# Altium project BMS-v1.1.PrjPcb (part 3 of 3)
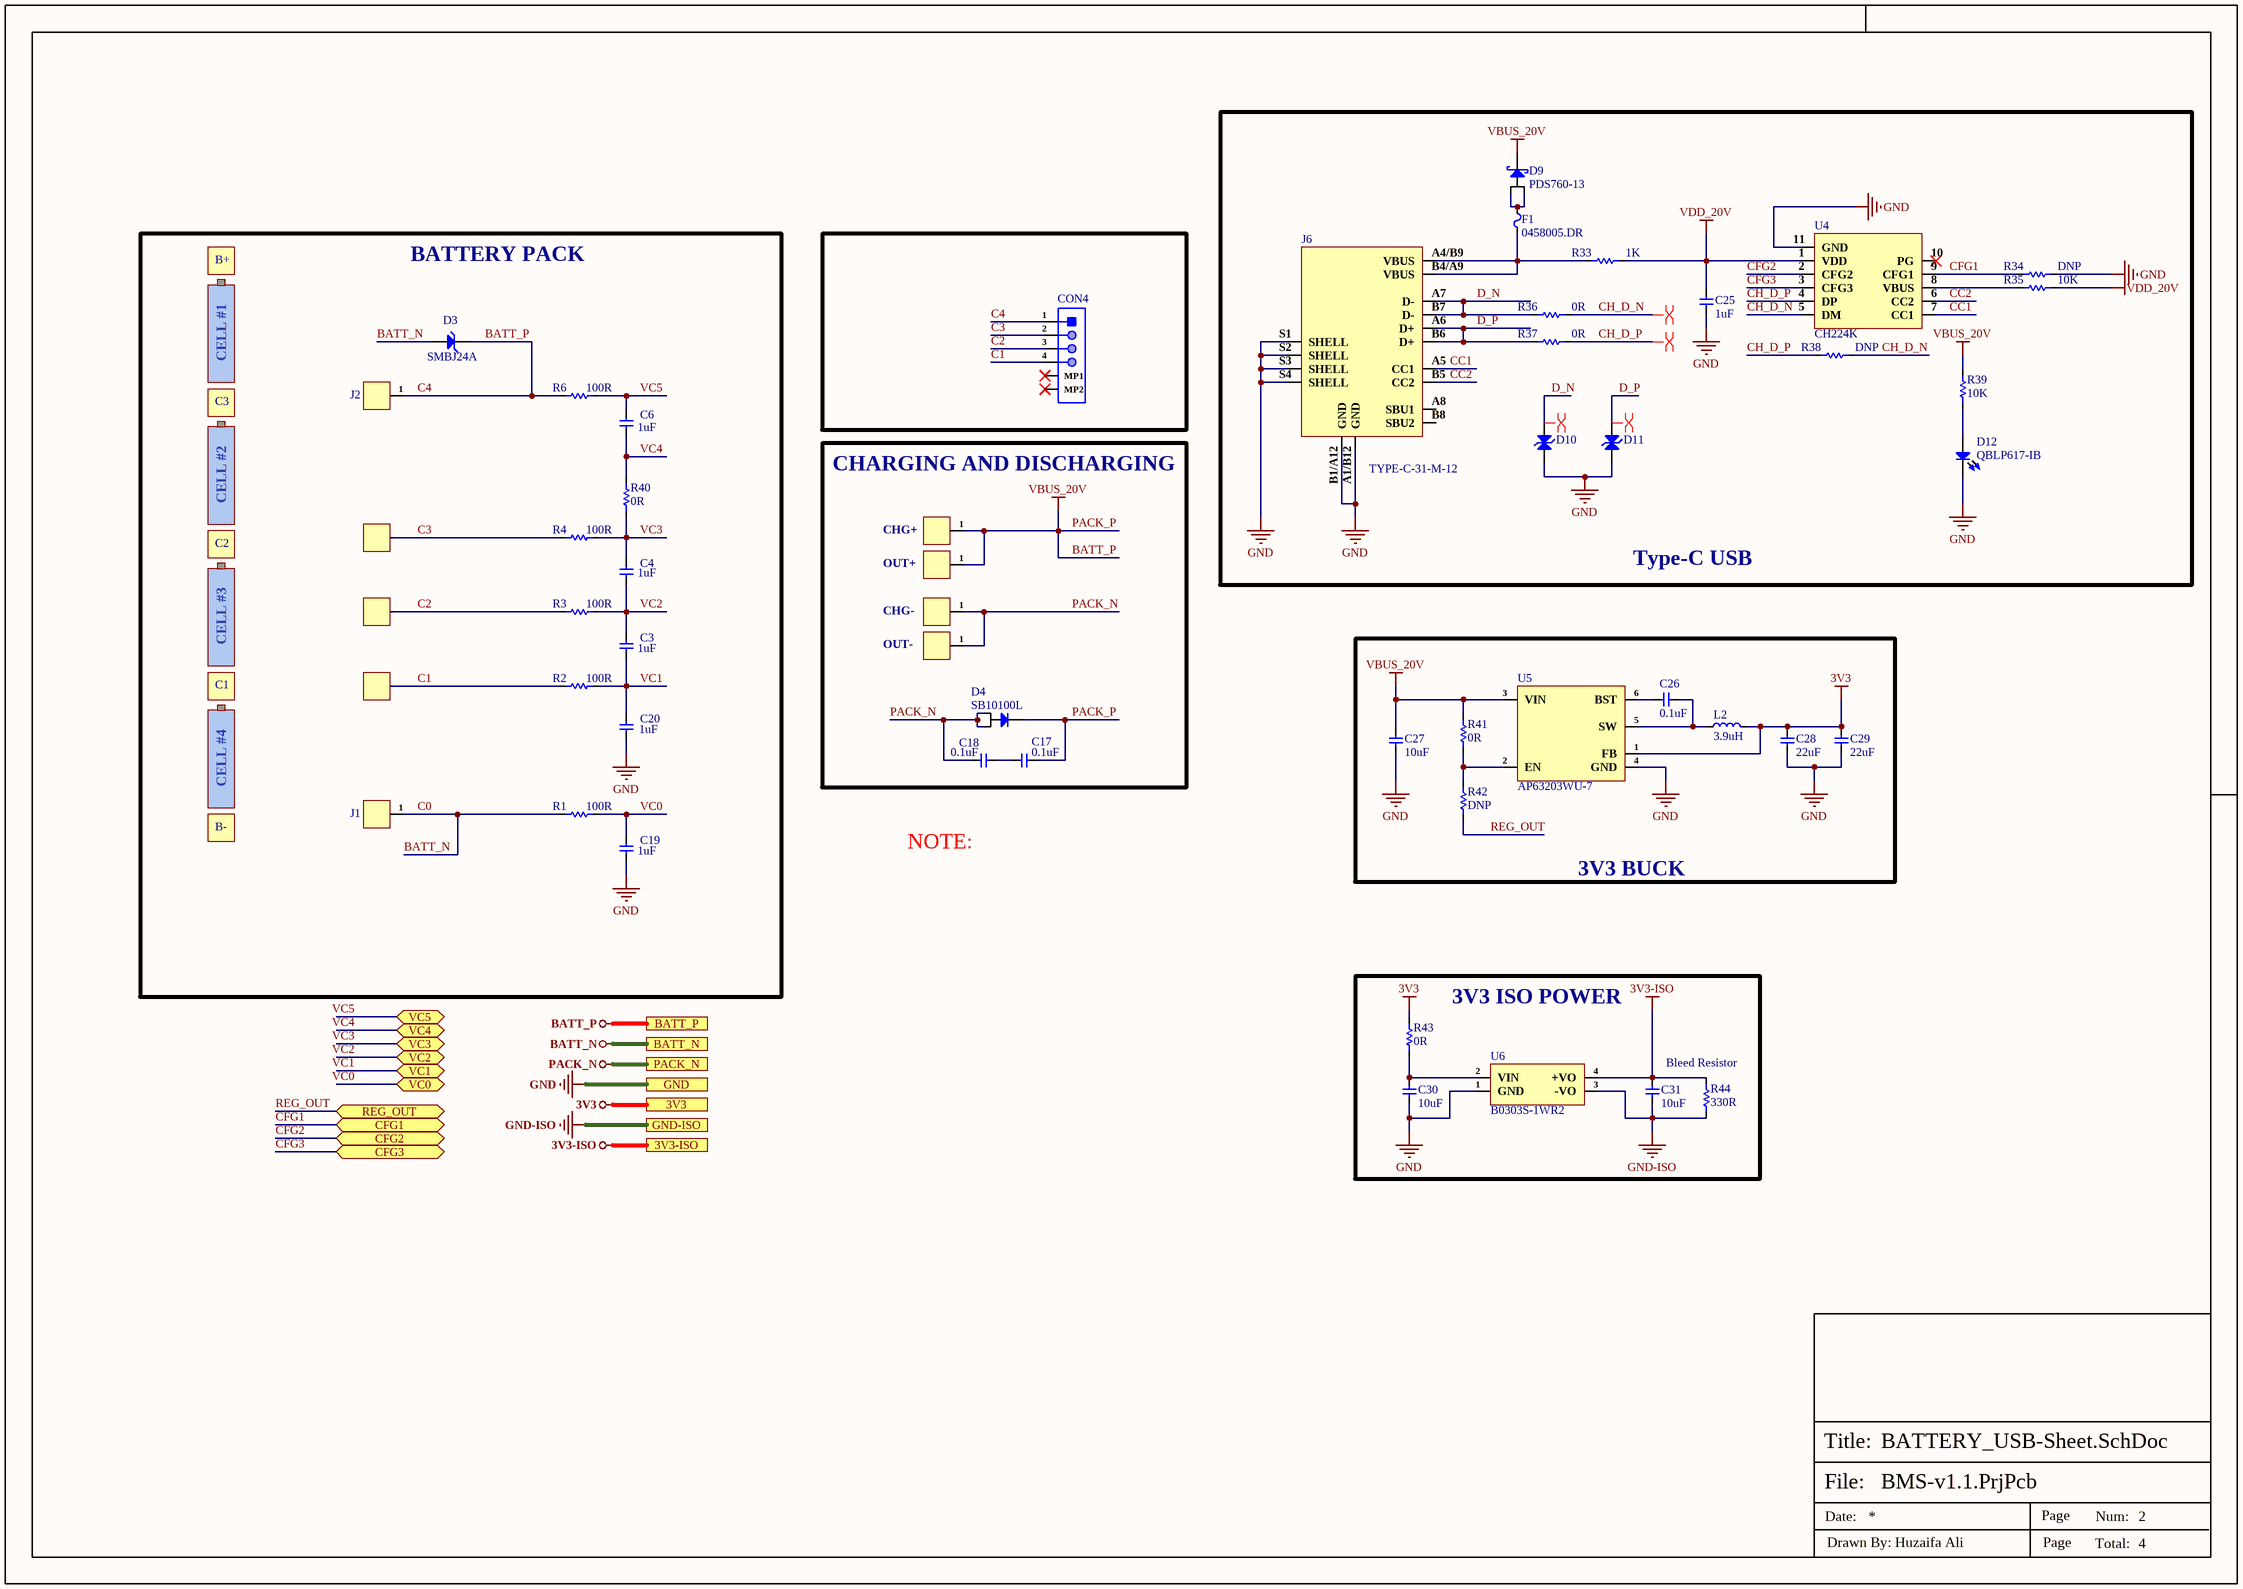
[diagram p4: BATTERY_USB-Sheet.SchDoc]

## Nets that join several sheets
3V3: BMS-Sheet (R9.2 R10.2), BMS-Controller-Sheet (C21.1 C22.1 SB5.1 U3.1), BATTERY_USB-Sheet (5 pins)
3V3-ISO: BMS-Controller-Sheet (5 pins), BATTERY_USB-Sheet (C31.2 R44.2 U6.4)
BATT_N: BMS-Sheet (NT1.1 R11.1 R13.1), BATTERY_USB-Sheet (D3.1 J1.1 R1.1)
BATT_P: BMS-Sheet (D1.1 R8.1), BATTERY_USB-Sheet (13 pins)
GND: BMS-Sheet (13 pins), BMS-Controller-Sheet (18 pins), BATTERY_USB-Sheet (20 pins)
GND-ISO: BMS-Controller-Sheet (9 pins), BATTERY_USB-Sheet (C31.1 R44.1 U6.3)
PACK_N: BMS-Sheet (C15.1 Q2.3 R18.1), BATTERY_USB-Sheet (5 pins)
ALERT: BMS-Sheet (C14.2 R15.2 U1.20), BMS-Controller-Sheet (U2.12)
BOOT: BMS-Sheet (R5.2), BMS-Controller-Sheet (U2.13)
CFG1: BMS-Controller-Sheet (R45.2), BATTERY_USB-Sheet (R34.1 U4.9)
CFG2: BMS-Controller-Sheet (R46.2), BATTERY_USB-Sheet (U4.2)
CFG3: BMS-Controller-Sheet (R47.2), BATTERY_USB-Sheet (U4.3)
REG_OUT: BMS-Sheet (C8.2 U1.8), BATTERY_USB-Sheet (R42.1)
SCL: BMS-Sheet (R9.1 U1.5), BMS-Controller-Sheet (U2.6)
SDA: BMS-Sheet (R10.1 U1.4), BMS-Controller-Sheet (U2.3)
VC0: BMS-Sheet (U1.17), BATTERY_USB-Sheet (C19.2 R1.2)
VC1: BMS-Sheet (5 pins), BATTERY_USB-Sheet (C3.1 C20.2 R2.2)
VC2: BMS-Sheet (U1.15), BATTERY_USB-Sheet (C3.2 C4.1 R3.2)
VC3: BMS-Sheet (U1.14), BATTERY_USB-Sheet (C4.2 R4.2 R40.1)
VC4: BMS-Sheet (U1.13), BATTERY_USB-Sheet (C6.1 R40.2)
VC5: BMS-Sheet (U1.12), BATTERY_USB-Sheet (C6.2 R6.2)